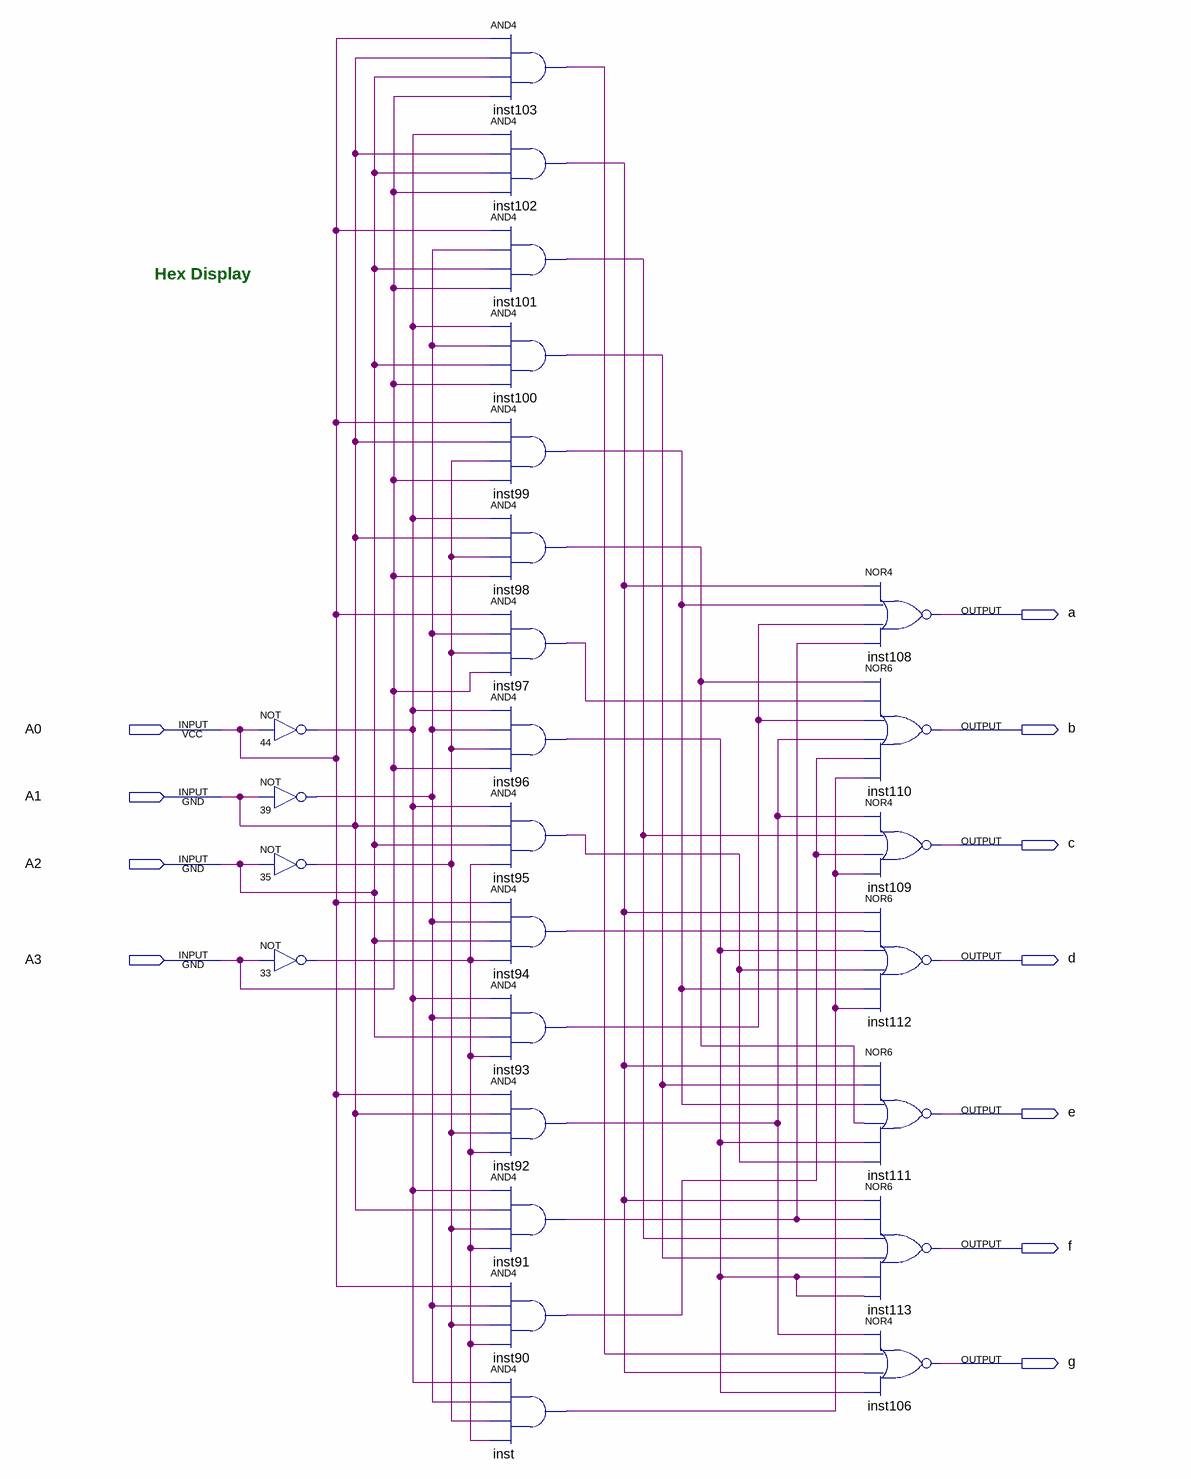
[diagram p0: schematic sheet]
// Quartus schematic HexDisplay.bdf as structural Verilog: 26 symbols, 11 pins
module HexDisplay (
  input  A0,
  input  A1,
  input  A2,
  input  A3,
  output a,
  output b,
  output c,
  output d,
  output e,
  output f,
  output g
);

  wire inst90_out, inst91_out, inst92_out, inst93_out, inst94_out, inst95_out, inst96_out, inst97_out,
       inst98_out, inst99_out, inst100_out, inst101_out, inst102_out, inst103_out, inst_out, n33_out,
       n35_out, n39_out, n44_out;

  not u_44 (n44_out, A0);
  not u_39 (n39_out, A1);
  not u_35 (n35_out, A2);
  not u_33 (n33_out, A3);
  and inst103 (inst103_out, A0, A1, A2, A3);
  and inst102 (inst102_out, n44_out, A1, A2, A3);
  and inst101 (inst101_out, A0, n39_out, A2, A3);
  and inst100 (inst100_out, n44_out, n39_out, A2, A3);
  and inst99 (inst99_out, A0, A1, n35_out, A3);
  and inst98 (inst98_out, n44_out, A1, n35_out, A3);
  and inst97 (inst97_out, A0, n39_out, n35_out, A3);
  and inst96 (inst96_out, n44_out, n39_out, n35_out, A3);
  and inst95 (inst95_out, n44_out, A1, A2, n33_out);
  and inst94 (inst94_out, A0, n39_out, A2, n33_out);
  and inst93 (inst93_out, n44_out, n39_out, A2, n33_out);
  and inst92 (inst92_out, A0, A1, n35_out, n33_out);
  and inst91 (inst91_out, n44_out, A1, n35_out, n33_out);
  and inst90 (inst90_out, A0, n39_out, n35_out, n33_out);
  and inst (inst_out, n44_out, n39_out, n35_out, n33_out);
  nor inst108 (a, inst102_out, inst99_out, inst93_out, inst91_out);
  nor inst110 (b, inst98_out, inst97_out, inst93_out, inst92_out, inst90_out, inst_out);
  nor inst109 (c, inst92_out, inst101_out, inst90_out, inst_out);
  nor inst112 (d, inst102_out, inst94_out, inst96_out, inst95_out, inst99_out, inst_out);
  nor inst111 (e, inst102_out, inst100_out, inst99_out, inst98_out, inst96_out, inst95_out);
  nor inst113 (f, inst102_out, inst91_out, inst101_out, inst100_out, inst96_out, inst96_out);
  nor inst106 (g, inst92_out, inst103_out, inst102_out, inst96_out);

  // Notes on the sheet:
  //   Hex Display
endmodule
